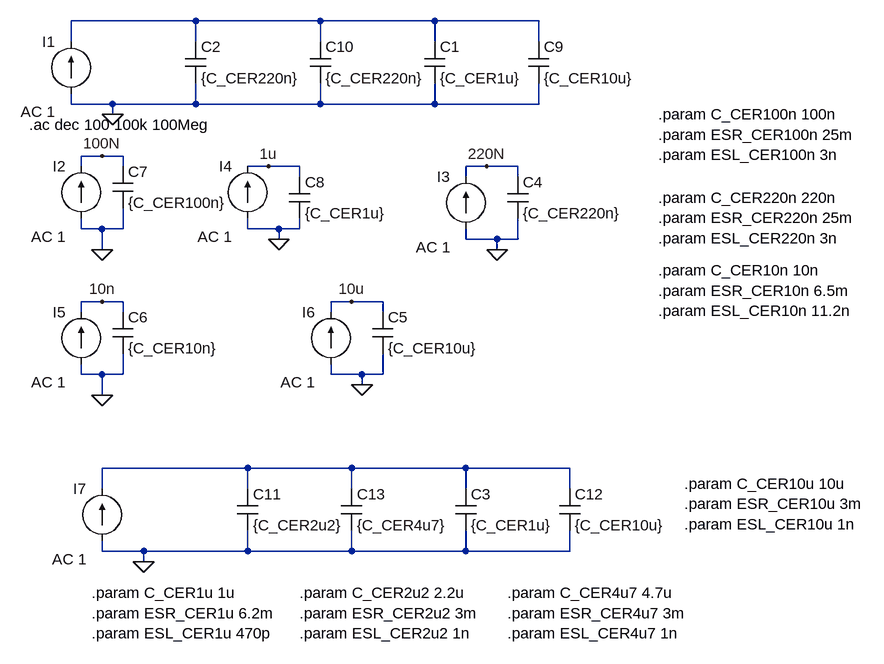
[diagram p0: schematic capacitor_stack_input50V.asc]
capacitor_stack_input50V.asc, the LTspice schematic file:
Version 4.1
SHEET 1 2304 1184
WIRE 208 112 16 112
WIRE 400 112 208 112
WIRE 576 112 400 112
WIRE 736 112 576 112
WIRE 16 144 16 112
WIRE 208 144 208 112
WIRE 400 144 400 112
WIRE 576 144 576 112
WIRE 736 144 736 112
WIRE 16 240 16 224
WIRE 80 240 16 240
WIRE 208 240 208 208
WIRE 208 240 80 240
WIRE 400 240 400 208
WIRE 400 240 208 240
WIRE 576 240 576 208
WIRE 576 240 400 240
WIRE 736 240 736 208
WIRE 736 240 576 240
WIRE 80 256 80 240
WIRE 64 320 32 320
WIRE 96 320 64 320
WIRE 32 336 32 320
WIRE 96 336 96 320
WIRE 320 336 288 336
WIRE 368 336 320 336
WIRE 656 336 624 336
WIRE 704 336 656 336
WIRE 368 352 368 336
WIRE 624 352 624 336
WIRE 704 352 704 336
WIRE 32 432 32 416
WIRE 64 432 32 432
WIRE 96 432 96 400
WIRE 96 432 64 432
WIRE 288 432 288 416
WIRE 336 432 288 432
WIRE 368 432 368 416
WIRE 368 432 336 432
WIRE 336 448 336 432
WIRE 624 448 624 432
WIRE 672 448 624 448
WIRE 704 448 704 416
WIRE 704 448 672 448
WIRE 64 464 64 432
WIRE 672 464 672 448
WIRE 64 544 32 544
WIRE 96 544 64 544
WIRE 448 544 416 544
WIRE 496 544 448 544
WIRE 32 560 32 544
WIRE 96 560 96 544
WIRE 416 560 416 544
WIRE 496 560 496 544
WIRE 32 656 32 640
WIRE 64 656 32 656
WIRE 96 656 96 624
WIRE 96 656 64 656
WIRE 416 656 416 640
WIRE 464 656 416 656
WIRE 496 656 496 624
WIRE 496 656 464 656
WIRE 464 672 464 656
WIRE 64 688 64 656
WIRE 288 800 64 800
WIRE 448 800 288 800
WIRE 624 800 448 800
WIRE 784 800 624 800
WIRE 64 832 64 800
WIRE 288 832 288 800
WIRE 448 832 448 800
WIRE 624 832 624 800
WIRE 784 832 784 800
WIRE 64 928 64 912
WIRE 128 928 64 928
WIRE 288 928 288 896
WIRE 288 928 128 928
WIRE 448 928 448 896
WIRE 448 928 288 928
WIRE 624 928 624 896
WIRE 624 928 448 928
WIRE 784 928 784 896
WIRE 784 928 624 928
WIRE 128 944 128 928
FLAG 80 256 0
FLAG 64 464 0
FLAG 336 448 0
FLAG 672 464 0
FLAG 64 688 0
FLAG 64 544 10n
FLAG 320 336 1u
FLAG 656 336 220N
FLAG 64 320 100N
FLAG 464 672 0
FLAG 448 544 10u
FLAG 128 944 0
SYMBOL current 16 224 R180
WINDOW 0 24 80 Left 2
WINDOW 3 24 0 Left 2
WINDOW 123 24 -28 Left 2
WINDOW 39 0 0 Left 0
SYMATTR InstName I1
SYMATTR Value ""
SYMATTR Value2 AC 1
SYMBOL cap 80 336 R0
SYMATTR InstName C7
SYMATTR Value {C_CER100n}
SYMATTR SpiceLine Rser={ESR_CER100n} Lser={ESL_CER100n}
SYMBOL current 32 416 R180
WINDOW 0 24 80 Left 2
WINDOW 3 24 0 Left 2
WINDOW 123 24 -28 Left 2
WINDOW 39 0 0 Left 0
SYMATTR InstName I2
SYMATTR Value ""
SYMATTR Value2 AC 1
SYMBOL cap 352 352 R0
SYMATTR InstName C8
SYMATTR Value {C_CER1u}
SYMATTR SpiceLine Rser={ESR_CER1u} Lser={ESL_CER1u}
SYMBOL current 288 416 R180
WINDOW 0 24 80 Left 2
WINDOW 3 24 0 Left 2
WINDOW 123 24 -28 Left 2
WINDOW 39 0 0 Left 0
SYMATTR InstName I4
SYMATTR Value ""
SYMATTR Value2 AC 1
SYMBOL cap 560 144 R0
SYMATTR InstName C1
SYMATTR Value {C_CER1u}
SYMATTR SpiceLine Rser={ESR_CER1u} Lser={ESL_CER1u}
SYMBOL cap 192 144 R0
SYMATTR InstName C2
SYMATTR Value {C_CER220n}
SYMATTR SpiceLine Rser={ESR_CER220n} Lser={ESL_CER220n}
SYMBOL cap 688 352 R0
SYMATTR InstName C4
SYMATTR Value {C_CER220n}
SYMATTR SpiceLine Rser={ESR_CER220n} Lser={ESL_CER220n}
SYMBOL current 624 432 R180
WINDOW 0 24 80 Left 2
WINDOW 3 24 0 Left 2
WINDOW 123 24 -28 Left 2
WINDOW 39 0 0 Left 0
SYMATTR InstName I3
SYMATTR Value ""
SYMATTR Value2 AC 1
SYMBOL cap 80 560 R0
SYMATTR InstName C6
SYMATTR Value {C_CER10n}
SYMATTR SpiceLine Rser={ESR_CER10n} Lser={ESL_CER10n}
SYMBOL current 32 640 R180
WINDOW 0 24 80 Left 2
WINDOW 3 24 0 Left 2
WINDOW 123 24 -28 Left 2
WINDOW 39 0 0 Left 0
SYMATTR InstName I5
SYMATTR Value ""
SYMATTR Value2 AC 1
SYMBOL cap 480 560 R0
SYMATTR InstName C5
SYMATTR Value {C_CER10u}
SYMATTR SpiceLine Rser={ESR_CER10u} Lser={ESL_CER10u}
SYMBOL current 416 640 R180
WINDOW 0 24 80 Left 2
WINDOW 3 24 0 Left 2
WINDOW 123 24 -28 Left 2
WINDOW 39 0 0 Left 0
SYMATTR InstName I6
SYMATTR Value ""
SYMATTR Value2 AC 1
SYMBOL cap 720 144 R0
SYMATTR InstName C9
SYMATTR Value {C_CER10u}
SYMATTR SpiceLine Rser={ESR_CER10u} Lser={ESL_CER10u}
SYMBOL cap 384 144 R0
SYMATTR InstName C10
SYMATTR Value {C_CER220n}
SYMATTR SpiceLine Rser={ESR_CER220n} Lser={ESL_CER220n}
SYMBOL current 64 912 R180
WINDOW 0 24 80 Left 2
WINDOW 3 24 0 Left 2
WINDOW 123 24 -28 Left 2
WINDOW 39 0 0 Left 0
SYMATTR InstName I7
SYMATTR Value ""
SYMATTR Value2 AC 1
SYMBOL cap 608 832 R0
SYMATTR InstName C3
SYMATTR Value {C_CER1u}
SYMATTR SpiceLine Rser={ESR_CER1u} Lser={ESL_CER1u}
SYMBOL cap 768 832 R0
SYMATTR InstName C12
SYMATTR Value {C_CER10u}
SYMATTR SpiceLine Rser={ESR_CER10u} Lser={ESL_CER10u}
SYMBOL cap 432 832 R0
SYMATTR InstName C13
SYMATTR Value {C_CER4u7}
SYMATTR SpiceLine Rser={ESR_CER4u7} Lser={ESL_CER4u7}
SYMBOL cap 272 832 R0
SYMATTR InstName C11
SYMATTR Value {C_CER2u2}
SYMATTR SpiceLine Rser={ESR_CER2u2} Lser={ESL_CER2u2}
TEXT -48 272 Left 2 !.ac dec 100 100k 100Meg
TEXT 48 992 Left 2 !.param C_CER1u 1u\n.param ESR_CER1u 6.2m\n.param ESL_CER1u 470p
TEXT 920 256 Left 2 !.param C_CER100n 100n\n.param ESR_CER100n 25m\n.param ESL_CER100n 3n
TEXT 920 384 Left 2 !.param C_CER220n 220n\n.param ESR_CER220n 25m\n.param ESL_CER220n 3n
TEXT 920 496 Left 2 !.param C_CER10n 10n\n.param ESR_CER10n 6.5m\n.param ESL_CER10n 11.2n
TEXT 960 824 Left 2 !.param C_CER10u 10u\n.param ESR_CER10u 3m\n.param ESL_CER10u 1n
TEXT 368 992 Left 2 !.param C_CER2u2 2.2u\n.param ESR_CER2u2 3m\n.param ESL_CER2u2 1n
TEXT 688 992 Left 2 !.param C_CER4u7 4.7u\n.param ESR_CER4u7 3m\n.param ESL_CER4u7 1n

The netlist it stands for:
* capacitor_stack_input50V.asc
I1 0 N001 AC 1
C7 100N 0 {C_CER100n} Rser={ESR_CER100n} Lser={ESL_CER100n}
I2 0 100N AC 1
C8 1u 0 {C_CER1u} Rser={ESR_CER1u} Lser={ESL_CER1u}
I4 0 1u AC 1
C1 N001 0 {C_CER1u} Rser={ESR_CER1u} Lser={ESL_CER1u}
C2 N001 0 {C_CER220n} Rser={ESR_CER220n} Lser={ESL_CER220n}
C4 220N 0 {C_CER220n} Rser={ESR_CER220n} Lser={ESL_CER220n}
I3 0 220N AC 1
C6 10n 0 {C_CER10n} Rser={ESR_CER10n} Lser={ESL_CER10n}
I5 0 10n AC 1
C5 10u 0 {C_CER10u} Rser={ESR_CER10u} Lser={ESL_CER10u}
I6 0 10u AC 1
C9 N001 0 {C_CER10u} Rser={ESR_CER10u} Lser={ESL_CER10u}
C10 N001 0 {C_CER220n} Rser={ESR_CER220n} Lser={ESL_CER220n}
I7 0 N002 AC 1
C3 N002 0 {C_CER1u} Rser={ESR_CER1u} Lser={ESL_CER1u}
C12 N002 0 {C_CER10u} Rser={ESR_CER10u} Lser={ESL_CER10u}
C13 N002 0 {C_CER4u7} Rser={ESR_CER4u7} Lser={ESL_CER4u7}
C11 N002 0 {C_CER2u2} Rser={ESR_CER2u2} Lser={ESL_CER2u2}
.ac dec 100 100k 100Meg
.param C_CER1u 1u
.param ESR_CER1u 6.2m
.param ESL_CER1u 470p
.param C_CER100n 100n
.param ESR_CER100n 25m
.param ESL_CER100n 3n
.param C_CER220n 220n
.param ESR_CER220n 25m
.param ESL_CER220n 3n
.param C_CER10n 10n
.param ESR_CER10n 6.5m
.param ESL_CER10n 11.2n
.param C_CER10u 10u
.param ESR_CER10u 3m
.param ESL_CER10u 1n
.param C_CER2u2 2.2u
.param ESR_CER2u2 3m
.param ESL_CER2u2 1n
.param C_CER4u7 4.7u
.param ESR_CER4u7 3m
.param ESL_CER4u7 1n
.backanno
.end